# Altium schematic sheet MCU.schdoc
size 297 x 209 mm; Symbol: Drawing-Symbol_A4; @Project Name: Pedal Steel; @Page Count: 1; @Update Date: 2026-10-20; @Create Date: 2026-10-20; @Schematic Name: Schematic1; @Page No: 1; @Page Name: P1; Company: EasyEDA.com; Version: V1.0; Page Size: A4; Device: Drawing-Symbol_A4; @Create Time: 17:29:51; @Update Time: 17:29:51; Border: 1; Width: 1170; Height: 825; Region Start: 1; X Region Count: 6; Y Region Count: 4; Blade Width: 10; Title Block Position: 3
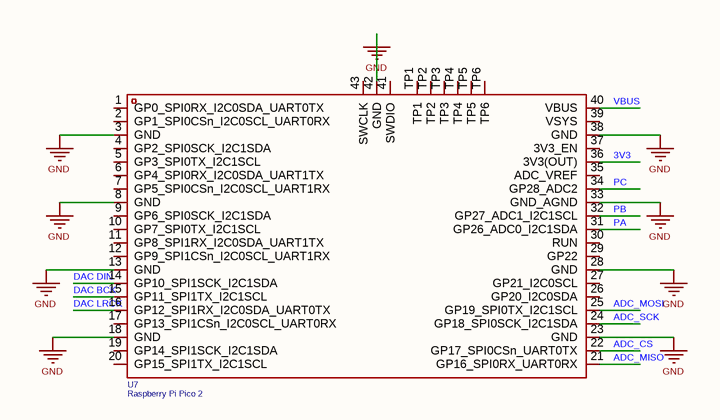
[diagram p0: MCU.schdoc]

## Parts
U7  Raspberry Pi Pico 2  [COMM-SMD_L51.0-W21.0-P2.54_SC0916]

## Nets
GND: U7.3(GND) U7.8(GND) U7.13(GND) U7.18(GND) U7.23(GND) U7.28(GND) U7.33(GND_AGND) U7.38(GND) U7.42(GND)
3V3: U7.36(3V3(OUT))
ADC_CS: U7.22(GP17_SPI0CSn_UART0TX)
ADC_MISO: U7.21(GP16_SPI0RX_UART0RX)
ADC_MOSI: U7.25(GP19_SPI0TX_I2C1SCL)
ADC_SCK: U7.24(GP18_SPI0SCK_I2C1SDA)
DAC BCK: U7.15(GP11_SPI1TX_I2C1SCL)
DAC DIN: U7.14(GP10_SPI1SCK_I2C1SDA)
DAC LRCK: U7.16(GP12_SPI1RX_I2C0SDA_UART0TX)
PA: U7.31(GP26_ADC0_I2C1SDA)
PB: U7.32(GP27_ADC1_I2C1SCL)
PC: U7.34(GP28_ADC2)
VBUS: U7.40(VBUS)

Not connected (* = marked no-connect by the designer): U7 1(GP0_SPI0RX_I2C0SDA_UART0TX) 2(GP1_SPI0CSn_I2C0SCL_UART0RX) 4(GP2_SPI0SCK_I2C1SDA) 5(GP3_SPI0TX_I2C1SCL) 6(GP4_SPI0RX_I2C0SDA_UART1TX) 7(GP5_SPI0CSn_I2C0SCL_UART1RX) 9(GP6_SPI0SCK_I2C1SDA) 10(GP7_SPI0TX_I2C1SCL) 11(GP8_SPI1RX_I2C0SDA_UART1TX) 12(GP9_SPI1CSn_I2C0SCL_UART1RX) 17(GP13_SPI1CSn_I2C0SCL_UART0RX) 19(GP14_SPI1SCK_I2C1SDA) 20(GP15_SPI1TX_I2C1SCL) 26(GP20_I2C0SDA) 27(GP21_I2C0SCL) 29(GP22) 30(RUN) 35(ADC_VREF) 37(3V3_EN) 39(VSYS) 41(SWDIO) 43(SWCLK) TP1 TP2 TP3 TP4 TP5 TP6

## Notes on the sheet
- Create at
- 2026-10-20
- Schematic
- Board
- Schematic1
- Update at
- Page
- P1
- Drawn
- Reviewed
- Pedal Steel
- Version
- V1.0
- Size
- A4
- Page  1  Total  1
- EasyEDA.com

## Library data of the parts
U7 = Raspberry Pi Pico 2: Manufacturer: Raspberry Pi(树莓派); Symbol: PICO 2; AddInBom: yes; Device: Raspberry Pi Pico 2; LCSC Part Name: SC1631; SupplierPart: C41407547; ManufacturerPart: Raspberry Pi Pico 2; Supplier Footprint: -; JLCPCB Part Class: Extended Part; Datasheet: https://item.szlcsc.com/datasheet/Raspberry%2520Pi%2520Pico%25202/43207606.html; Supplier: LCSC; ConvertToPcb: yes; FootprintName: COMM-SMD_L51.0-W21.0-P2.54_SC0916